# EAGLE design arduino shield (EAGLE 7.4.0)
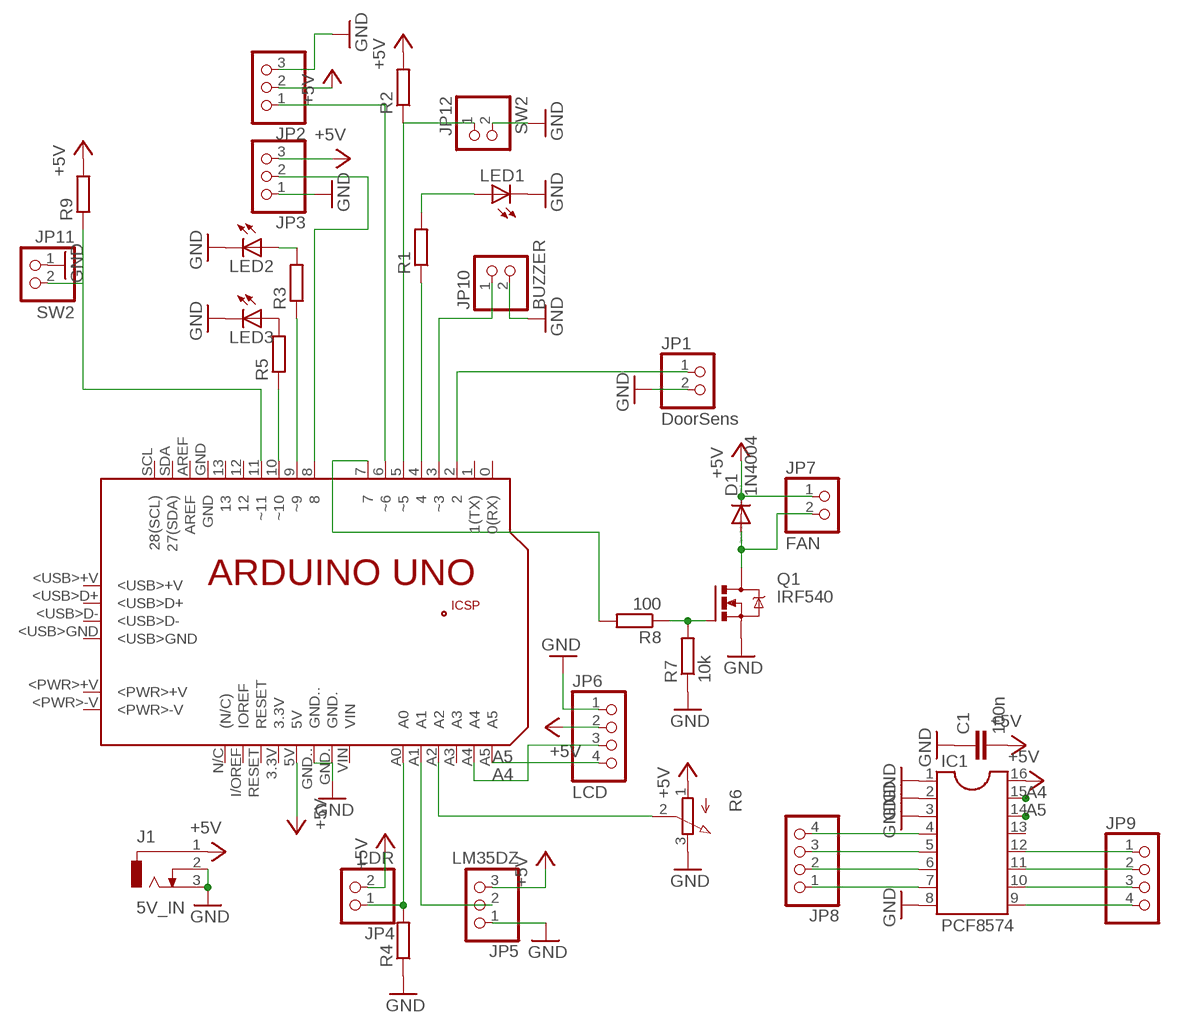
[diagram p0: schematic, sheet 1]

## Parts
C1  100n  C-EU050-024X044  [C050-024X044]
D1  1N4004  [DO41-10]
IC1  PCF8574  DIL16  [DIL16]
J1  5V_IN  DCJ0303  [DCJ0303]
JP1  DoorSens  PINHD-1X2  [1X02]
JP2  PINHD-1X3  [1X03]
JP3  PINHD-1X3  [1X03]
JP4  LDR  PINHD-1X2  [1X02]
JP5  LM35DZ  PINHD-1X3  [1X03]
JP6  LCD  PINHD-1X4  [1X04]
JP7  FAN  PINHD-1X2  [1X02]
JP8  PINHD-1X4  [1X04]
JP9  PINHD-1X4  [1X04]
JP10  BUZZER  PINHD-1X2  [1X02]
JP11  SW2  PINHD-1X2  [1X02]
JP12  SW2  PINHD-1X2  [1X02]
LED1  LED5MM  [LED5MM]
LED2  LED5MM  [LED5MM]
LED3  LED5MM  [LED5MM]
PCB1  ARDUINO_UNO  [ARDUINO_UNO]
Q1  IRF540  [TO220BV]
R1  R-EU_0207/7  [0207/7]
R2  R-EU_0207/7  [0207/7]
R3  R-EU_0207/7  [0207/7]
R4  R-EU_0207/7  [0207/7]
R5  R-EU_0207/7  [0207/7]
R6  3RP/1610N  [3RP/1610N]
R7  10k  R-EU_0207/7  [0207/7]
R8  100  R-EU_0207/7  [0207/7]
R9  R-EU_0207/7  [0207/7]

## Nets
+5V: C1.2 D1.C IC1.16 J1.1 JP2.2 JP3.3 JP4.2 JP5.3 JP6.2 JP7.1 PCB1.5V R2.2 R6.1(A) R9.2
A4: IC1.15 JP6.3 PCB1.A4
A5: IC1.14 JP6.4 PCB1.A5
GND: C1.1 IC1.1 IC1.2 IC1.3 IC1.8 J1.2 J1.3 JP1.2 JP2.3 JP3.1 JP5.1 JP6.1 JP10.2 JP11.1 JP12.2 LED1.K(C) LED2.K(C) LED3.K(C) PCB1.GND. PCB1.GND.. Q1.S R4.1 R6.3(E) R7.1
N$1: JP10.1 PCB1.3(~3)
N$2: LED1.A R1.2
N$3: PCB1.4 R1.1
N$4: JP1.1 PCB1.2
N$5: JP12.1 PCB1.5(~5) R2.1
N$6: JP2.1 PCB1.6(~6)
N$7: JP3.2 PCB1.8
N$8: LED2.A R3.2
N$9: PCB1.9(~9) R3.1
N$10: JP4.1 PCB1.A0 R4.2
N$11: JP11.2 PCB1.11(~11) R9.1
N$12: LED3.A R5.2
N$13: PCB1.10(~10) R5.1
N$14: PCB1.A2 R6.2(S)
N$15: JP5.2 PCB1.A1
N$17: D1.A JP7.2 Q1.D
N$18: PCB1.7 R8.2
N$19: Q1.G R7.2 R8.1
N$21: IC1.4 JP8.4
N$22: IC1.5 JP8.3
N$23: IC1.6 JP8.2
N$24: IC1.7 JP8.1
N$25: IC1.9 JP9.4
N$26: IC1.10 JP9.3
N$27: IC1.11 JP9.2
N$28: IC1.12 JP9.1
Unconnected: IC1.13 PCB1.0(0(RX)) PCB1.1(1(TX)) PCB1.3.3V PCB1.12 PCB1.13 PCB1.+5V PCB1.<PWR>+V PCB1.<PWR>-V PCB1.<USB>+V PCB1.<USB>D+ PCB1.<USB>D- PCB1.<USB>GND PCB1.A3 PCB1.AREF PCB1.GND PCB1.GND_ PCB1.I/OREF(IOREF) PCB1.MISO PCB1.MOSI PCB1.N/C((N/C)) PCB1.RESET PCB1.RESET. PCB1.SCK PCB1.SCL(28(SCL)) PCB1.SDA(27(SDA)) PCB1.VIN

## Library data of the parts
C1 = rcl:C-EU: CAPACITOR, European symbol
D1 = diode:1N4004: DIODE general purpose rectifier, 1 A
IC1 = ic-package:DIL16: Dual In Line / Socket
J1 = con-jack:DCJ0303: DC POWER JACK Source: DCJ0303.pdf; OC_FARNELL: unknown; OC_NEWARK: unknown
JP1 JP4 JP7 JP10-JP12 = pinhead:PINHD-1X2: PIN HEADER
JP2 JP3 JP5 = pinhead:PINHD-1X3: PIN HEADER
JP6 JP8 JP9 = pinhead:PINHD-1X4: PIN HEADER
LED1-LED3 = led:LED: LED OSRAM: - CHIPLED LG R971, LG N971, LY N971, LG Q971, LY Q971, LO R971, LY R971 LH N974, LH R974 LS Q976, LO Q976, LY Q976 LO Q996 - Hyper CHIPLED LW Q18S LB Q993, LB Q99A, LB R99A - SideLED LS A670, LO A670, LY A670, LG A670, LP A670 LB A673, LV A673, LT A673, LW A673 LH A674 LY A675 LS A676, LA A676, LO A676, LY A676, LW A676 LS A679, LY A679, LG A679 - Hyper Micro SIDELED® LS Y876, LA Y876, LO Y876, LY Y876 LT Y87S - SmartLED LW L88C, LW L88S LB L89C, LB L89S, LG L890 LS L89K, LO L89K, LY L89K LS L896, LA L896, LO L896, LY L896 - TOPLED LS T670, LO T670, LY T670, LG T670, LP T670 LSG T670, LSP T670, LSY T670, LOP T670, LYG T670 LG T671, LOG T671, LSG T671 LB T673, LV T673, LT T673, LW T673 LH T674 LS T676, LA T676, LO T676, LY T676, LB T676, LH T676, LSB T676, LW T676 LB T67C, LV T67C, LT T67C, LS T67K, LO T67K, LY T67K, LW E67C LS E67B, LA E67B, LO E67B, LY E67B, LB E67C, LV E67C, LT E67C LW T67C LS T679, LY T679, LG T679 LS T770, LO T770, LY T770, LG T770, LP T770 LB T773, LV T773, LT T773, LW T773 LH T774 LS E675, LA E675, LY E675, LS T675 LS T776, LA T776, LO T776, LY T776, LB T776 LHGB T686 LT T68C, LB T68C - Hyper Mini TOPLED® LB M676 - Mini TOPLED Santana® LG M470 LS M47K, LO M47K, LY M47K Source: http://www.osram.convergy.de LUXEON: - LUMILED® LXK2-PW12-R00, LXK2-PW12-S00, LXK2-PW14-U00, LXK2-PW14-V00 LXK2-PM12-R00, LXK2-PM12-S00, LXK2-PM14-U00 LXK2-PE12-Q00, LXK2-PE12-R00, LXK2-PE12-S00, LXK2-PE14-T00, LXK2-PE14-U00 LXK2-PB12-K00, LXK2-PB12-L00, LXK2-PB12-M00, LXK2-PB14-N00, LXK2-PB14-P00, LXK2-PB14-Q00 LXK2-PR12-L00, LXK2-PR12-M00, LXK2-PR14-Q00, LXK2-PR14-R00 LXK2-PD12-Q00, LXK2-PD12-R00, LXK2-PD12-S00 LXK2-PH12-R00, LXK2-PH12-S00 LXK2-PL12-P00, LXK2-PL12-Q00, LXK2-PL12-R00 Source: www.luxeon.com KINGBRIGHT: KA-3528ASYC Source: www.kingbright.com
PCB1 = E14_Arduino_revC:ARDUINO_UNO: Device for representing an Arduino Uno board with a footprint in an EAGLE design. Created by Dave Young for Element14. More EAGLE documentation at: http://www.element14.com/community/community/knode/cadsoft_eagle
Q1 = transistor-power:IRF540: HEXFET Power MOSFET
R1-R5 R7-R9 = rcl:R-EU_: RESISTOR, European symbol
R6 = pot:3RP/1610N: 16mm Potentiometer one level Source: http://www.alphapotentiometers.net/html/16mm_pot_2.html

## Board
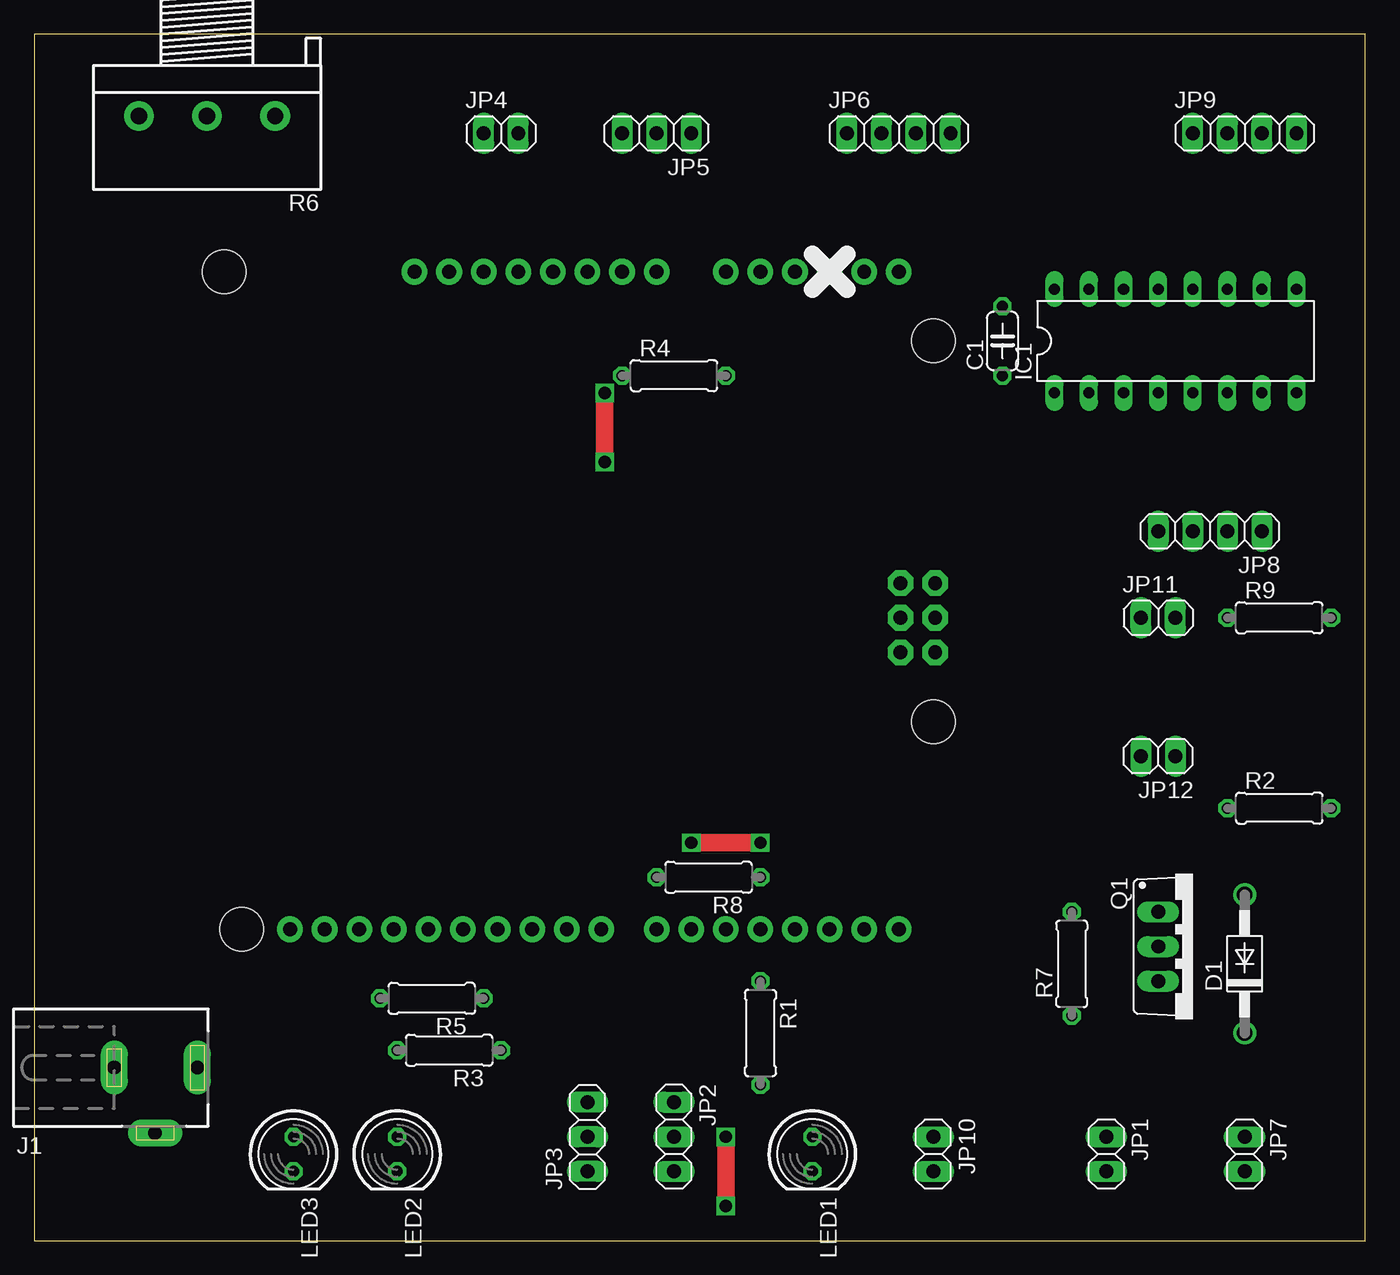
[diagram p1: board, top side]
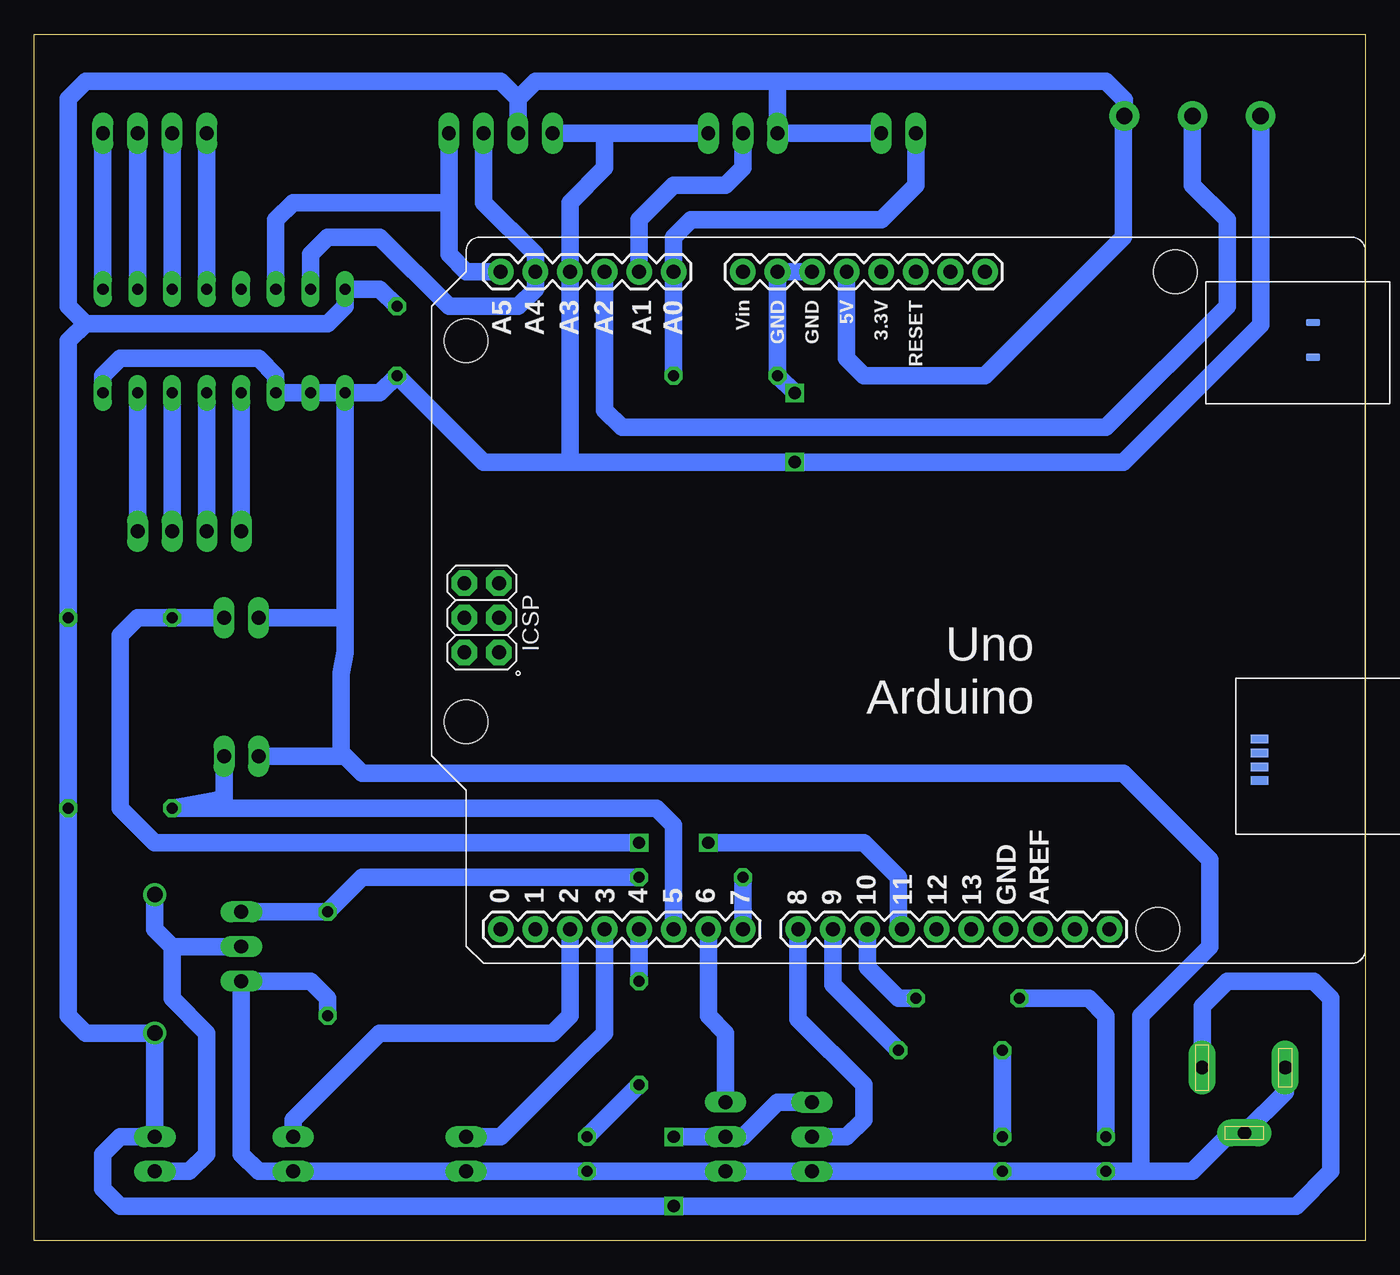
[diagram p2: board, bottom side, seen from below]

Size 97.77 x 88.57 mm. Coordinates in mm from the lower left corner, seen from the top.
Outline: 0,0 97.77,0 97.77,88.57 0,88.57 0,0
Copper layers (1*16): Top 0.035mm / dielectric 1.5mm / Bottom 0.035mm
Design rules "default": minimum track width 10mil, minimum drill 24mil, track to track 8mil, track to pad 8mil, pad to pad 8mil, via to via 8mil, smd to smd 8mil, copper to edge 40mil, drill to drill 8mil, minimum pad ring 10mil, minimum via ring 8mil, stop-mask expansion 4mil, vias tented up to drill 0mil, thermal gap 10mil

### Footprints (pad centres in the part's own frame; a part is rotated, then mirrored left to right if it is on the bottom)
C050-024X044 = drill 0.813 octagon: 1 -2.54,0; 2 2.54,0
DO41-10 = drill 1.118: A 5.08,0; C -5.08,0
DIL16 = drill 0.813 long: 1 -8.89,-3.81; 2 -6.35,-3.81; 3 -3.81,-3.81; 4 -1.27,-3.81; 5 1.27,-3.81; 6 3.81,-3.81; 7 6.35,-3.81; 8 8.89,-3.81; 9 8.89,3.81; 10 6.35,3.81; 11 3.81,3.81; 12 1.27,3.81; 13 -1.27,3.81; 14 -3.81,3.81; 15 -6.35,3.81; 16 -8.89,3.81
DCJ0303 = drill 1 pad 2 long: 1 0,3.1; 2 4.8,0; 3 0,-3
1X02 = drill 1.016 long: 1 -1.27,0; 2 1.27,0
1X03 = drill 1.016 long: 1 -2.54,0; 2 0,0; 3 2.54,0
1X04 = drill 1.016 long: 1 -3.81,0; 2 -1.27,0; 3 1.27,0; 4 3.81,0
LED5MM = drill 0.813 octagon: A -1.27,0; K 1.27,0
ARDUINO_UNO = drill 1.016 pad 1.88: 0 63.5,50.8; 1 60.96,50.8; 2 58.42,50.8; 3 55.88,50.8; 3.3V 35.56,2.54; 4 53.34,50.8; 5 50.8,50.8; 5V 38.1,2.54; 6 48.26,50.8; 7 45.72,50.8; 8 41.656,50.8; 9 39.116,50.8; 10 36.576,50.8; 11 34.036,50.8; 12 31.496,50.8; 13 28.956,50.8; A0 50.8,2.54; A1 53.34,2.54; A2 55.88,2.54; A3 58.42,2.54; A4 60.96,2.54; A5 63.5,2.54; AREF 23.876,50.8; GND 26.416,50.8; GND. 43.18,2.54; GND.. 40.64,2.54; I/OREF 30.48,2.54; N/C 27.94,2.54; RESET 33.02,2.54; SCL 18.796,50.8; SDA 21.336,50.8; VIN 45.72,2.54 | drill 1.016 pad 1.88 octagon: +5V 66.167,30.48; GND_ 66.167,25.4; MISO 63.627,30.48; MOSI 66.167,27.94; RESET. 63.627,25.4; SCK 63.627,27.94 | smd 1.016 x 0.508: <PWR>+V 3.861,8.814; <PWR>-V 3.861,6.274 | smd 1.27 x 0.635: <USB>+V 7.772,39.878; <USB>D+ 7.772,38.887; <USB>D- 7.772,37.871; <USB>GND 7.772,36.83 | hole 3.2: 66.04,7.62; 66.04,35.56; 15.24,50.8; 13.97,2.54
TO220BV = drill 1.016 long: D 0,-2.54; G -2.54,-2.54; S 2.54,-2.54
0207/7 = drill 0.813 octagon: 1 -3.81,0; 2 3.81,0
3RP/1610N = drill 1.2 pad 2.184: 1 -5,0; 2 0,0; 3 5,0

### Placement (x,y rotation side)
C1  71.12,66.04 90 top
D1  88.9,20.32 90 top
IC1  83.82,66.04 0 top
J1  8.89,12.7 270 top
JP1  78.74,6.35 270 top
JP2  46.99,7.62 270 top
JP3  40.64,7.62 90 top
JP4  34.29,81.28 0 top
JP5  45.72,81.28 180 top
JP6  63.5,81.28 0 top
JP7  88.9,6.35 270 top
JP8  86.36,52.07 180 top
JP9  88.9,81.28 0 top
JP10  66.04,6.35 270 top
JP11  82.55,45.72 0 top
JP12  82.55,35.56 180 top
LED1  57.15,6.35 270 top
LED2  26.67,6.35 270 top
LED3  19.05,6.35 270 top
PCB1  0,73.66 180 bottom
Q1  85.09,21.59 270 top
R1  53.34,15.24 270 top
R2  91.44,31.75 0 top
R3  30.48,13.97 180 top
R4  46.99,63.5 0 top
R5  29.21,17.78 180 top
R6  12.7,82.55 180 top
R7  76.2,20.32 90 top
R8  49.53,26.67 180 top
R9  91.44,45.72 0 top

### Tracks (layer width: path | path; a pad name or v marks a point on that pad's centre or on a via)
+5V  (via drill 0.9)
  Top 1.27: v50.8,7.62 v50.8,2.54
  Bottom 1.27: C1.2 72.39,69.85 IC1.16 74.93,68.58 76.2,67.31 93.98,67.31 | 93.98,67.31 95.25,66.04 R9.2 R2.2 95.25,16.51 93.98,15.24 D1.C JP7.1 91.44,7.62 92.71,6.35 92.71,3.81 91.44,2.54 v50.8,2.54 5.08,2.54 2.54,5.08 2.54,17.78 3.81,19.05 10.16,19.05 11.99,17.22 J1.1 | JP3.3 43.18,10.16 45.72,7.62 JP2.2 v50.8,7.62 | JP6.2 62.23,83.82 | 62.23,83.82 63.5,85.09 93.98,85.09 95.25,83.82 95.25,68.58 93.98,67.31 | 43.18,85.09 19.05,85.09 17.7,83.74 R6.1 17.78,82.47 17.78,73.66 27.94,63.5 36.83,63.5 38.1,64.77 PCB1.5V | 43.18,85.09 60.96,85.09 62.23,83.82 | JP4.2 JP5.3 43.18,85.09
A4
  Bottom 1.27: JP6.3 64.77,76.2 60.96,72.39 PCB1.A4 60.96,69.85 62.23,68.58 67.31,68.58 72.39,73.66 76.2,73.66 77.47,72.39 IC1.15
A5
  Bottom 1.27: JP6.4 67.31,76.2 | 67.31,76.2 67.31,72.39 66.04,71.12 PCB1.A5 | IC1.14 80.01,74.93 78.74,76.2 67.31,76.2
GND  (via drill 0.9)
  Top 1.27: v41.91,62.23 v41.91,57.15
  Bottom 1.27: JP1.2 | JP1.2 81.28,5.08 82.55,6.35 Q1.S 77.47,19.05 76.2,17.78 R7.1 | IC1.1 IC1.2 IC1.3 80.01,63.5 81.28,64.77 91.44,64.77 92.71,63.5 IC1.8 | IC1.1 72.39,62.23 C1.1 64.77,57.15 58.42,57.15 | 74.93,45.72 74.93,43.18 75.21,41.63 75.21,35.84 | 74.93,45.72 IC1.1 | 16.51,5.08 LED3.K LED2.K JP3.1 JP2.3 LED1.K JP10.2 JP1.2 | 16.51,5.08 12.7,5.08 9.88,7.9 J1.2 5.89,10.9 J1.3 | 75.21,35.84 73.66,34.29 17.78,34.29 11.43,27.94 11.43,21.59 16.51,16.51 16.51,5.08 | JP6.1 55.88,81.28 | PCB1.GND.. PCB1.GND. R4.1 v41.91,62.23 | R6.3 7.7,67.23 17.78,57.15 v41.91,57.15 58.42,57.15 | JP5.1 55.88,81.28 | 55.88,81.28 55.88,78.74 58.42,76.2 58.42,57.15 | JP11.1 74.93,45.72 | JP12.2 75.21,35.56 75.21,35.84
N$1
  Bottom 1.27: PCB1.3 55.88,15.24 57.78,13.34 58.43,12.69 63.5,7.62 JP10.1
N$2
  Bottom 1.27: R1.2 LED1.A
N$3
  Bottom 1.27: PCB1.4 R1.1
N$4
  Bottom 1.27: PCB1.2 58.42,16.51 59.69,15.24 72.39,15.24 78.74,8.89 JP1.1
N$5
  Bottom 1.27: PCB1.5 50.8,30.48 52.07,31.75 83.82,31.75 | 83.82,31.75 R2.1 84.38,32.31 | JP12.1 83.82,31.75
N$6
  Bottom 1.27: PCB1.6 48.26,16.51 46.99,15.24 JP2.1
N$7
  Bottom 1.27: PCB1.8 41.66,16.26 36.83,11.43 36.83,8.89 38.1,7.62 JP3.2
N$8
  Bottom 1.27: LED2.A R3.2
N$9
  Bottom 1.27: PCB1.9 39.12,18.8 R3.1
N$10
  Bottom 1.27: R4.2 PCB1.A0 50.8,73.66 49.53,74.93 35.56,74.93 33.02,77.47 JP4.1
N$11  (via drill 0.9)
  Top 1.27: v53.34,29.21 v48.26,29.21
  Bottom 1.27: R9.1 JP11.2 90.17,45.72 91.44,44.45 91.44,31.75 88.9,29.21 v53.34,29.21 | v48.26,29.21 36.83,29.21 34.29,26.67 34.29,23.11 PCB1.11
N$12
  Bottom 1.27: R5.2 20.32,17.78 19.05,16.51 LED3.A
N$13
  Bottom 1.27: PCB1.10 36.58,20.07 34.29,17.78 R5.1
N$14
  Bottom 1.27: R6.2 12.7,77.47 10.16,74.93 10.16,68.58 19.05,59.69 54.61,59.69 55.88,60.96 PCB1.A2
N$15
  Bottom 1.27: JP5.2 45.72,78.74 46.99,77.47 50.8,77.47 53.34,74.93 PCB1.A1
N$17
  Bottom 1.27: D1.A 88.9,22.86 87.63,21.59 | 87.63,21.59 Q1.D | JP7.2 86.36,5.08 85.09,6.35 85.09,15.24 87.63,17.78 87.63,21.59
N$18
  Bottom 1.27: PCB1.7 R8.2
N$19
  Bottom 1.27: R8.1 73.66,26.67 R7.2 Q1.G
N$21
  Bottom 1.27: IC1.4 JP8.4
N$22
  Bottom 1.27: JP8.3 IC1.5
N$23
  Bottom 1.27: JP8.2 IC1.6
N$24
  Bottom 1.27: IC1.7 JP8.1
N$25
  Bottom 1.27: IC1.9 JP9.4
N$26
  Bottom 1.27: JP9.3 IC1.10
N$27
  Bottom 1.27: IC1.11 JP9.2
N$28
  Bottom 1.27: JP9.1 IC1.12